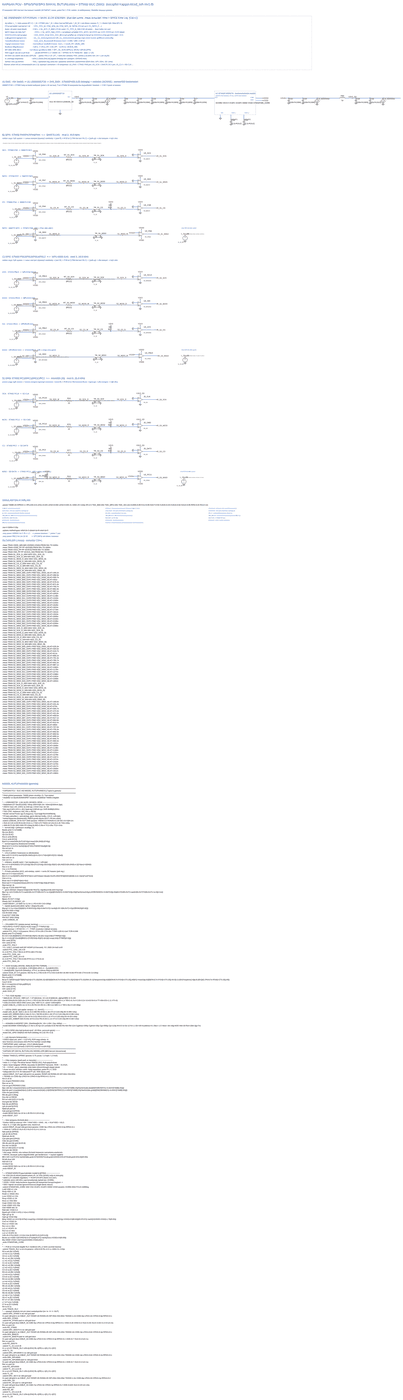
[diagram p0: schematic Kapgan_SPI_SI.asc, whole sheet]
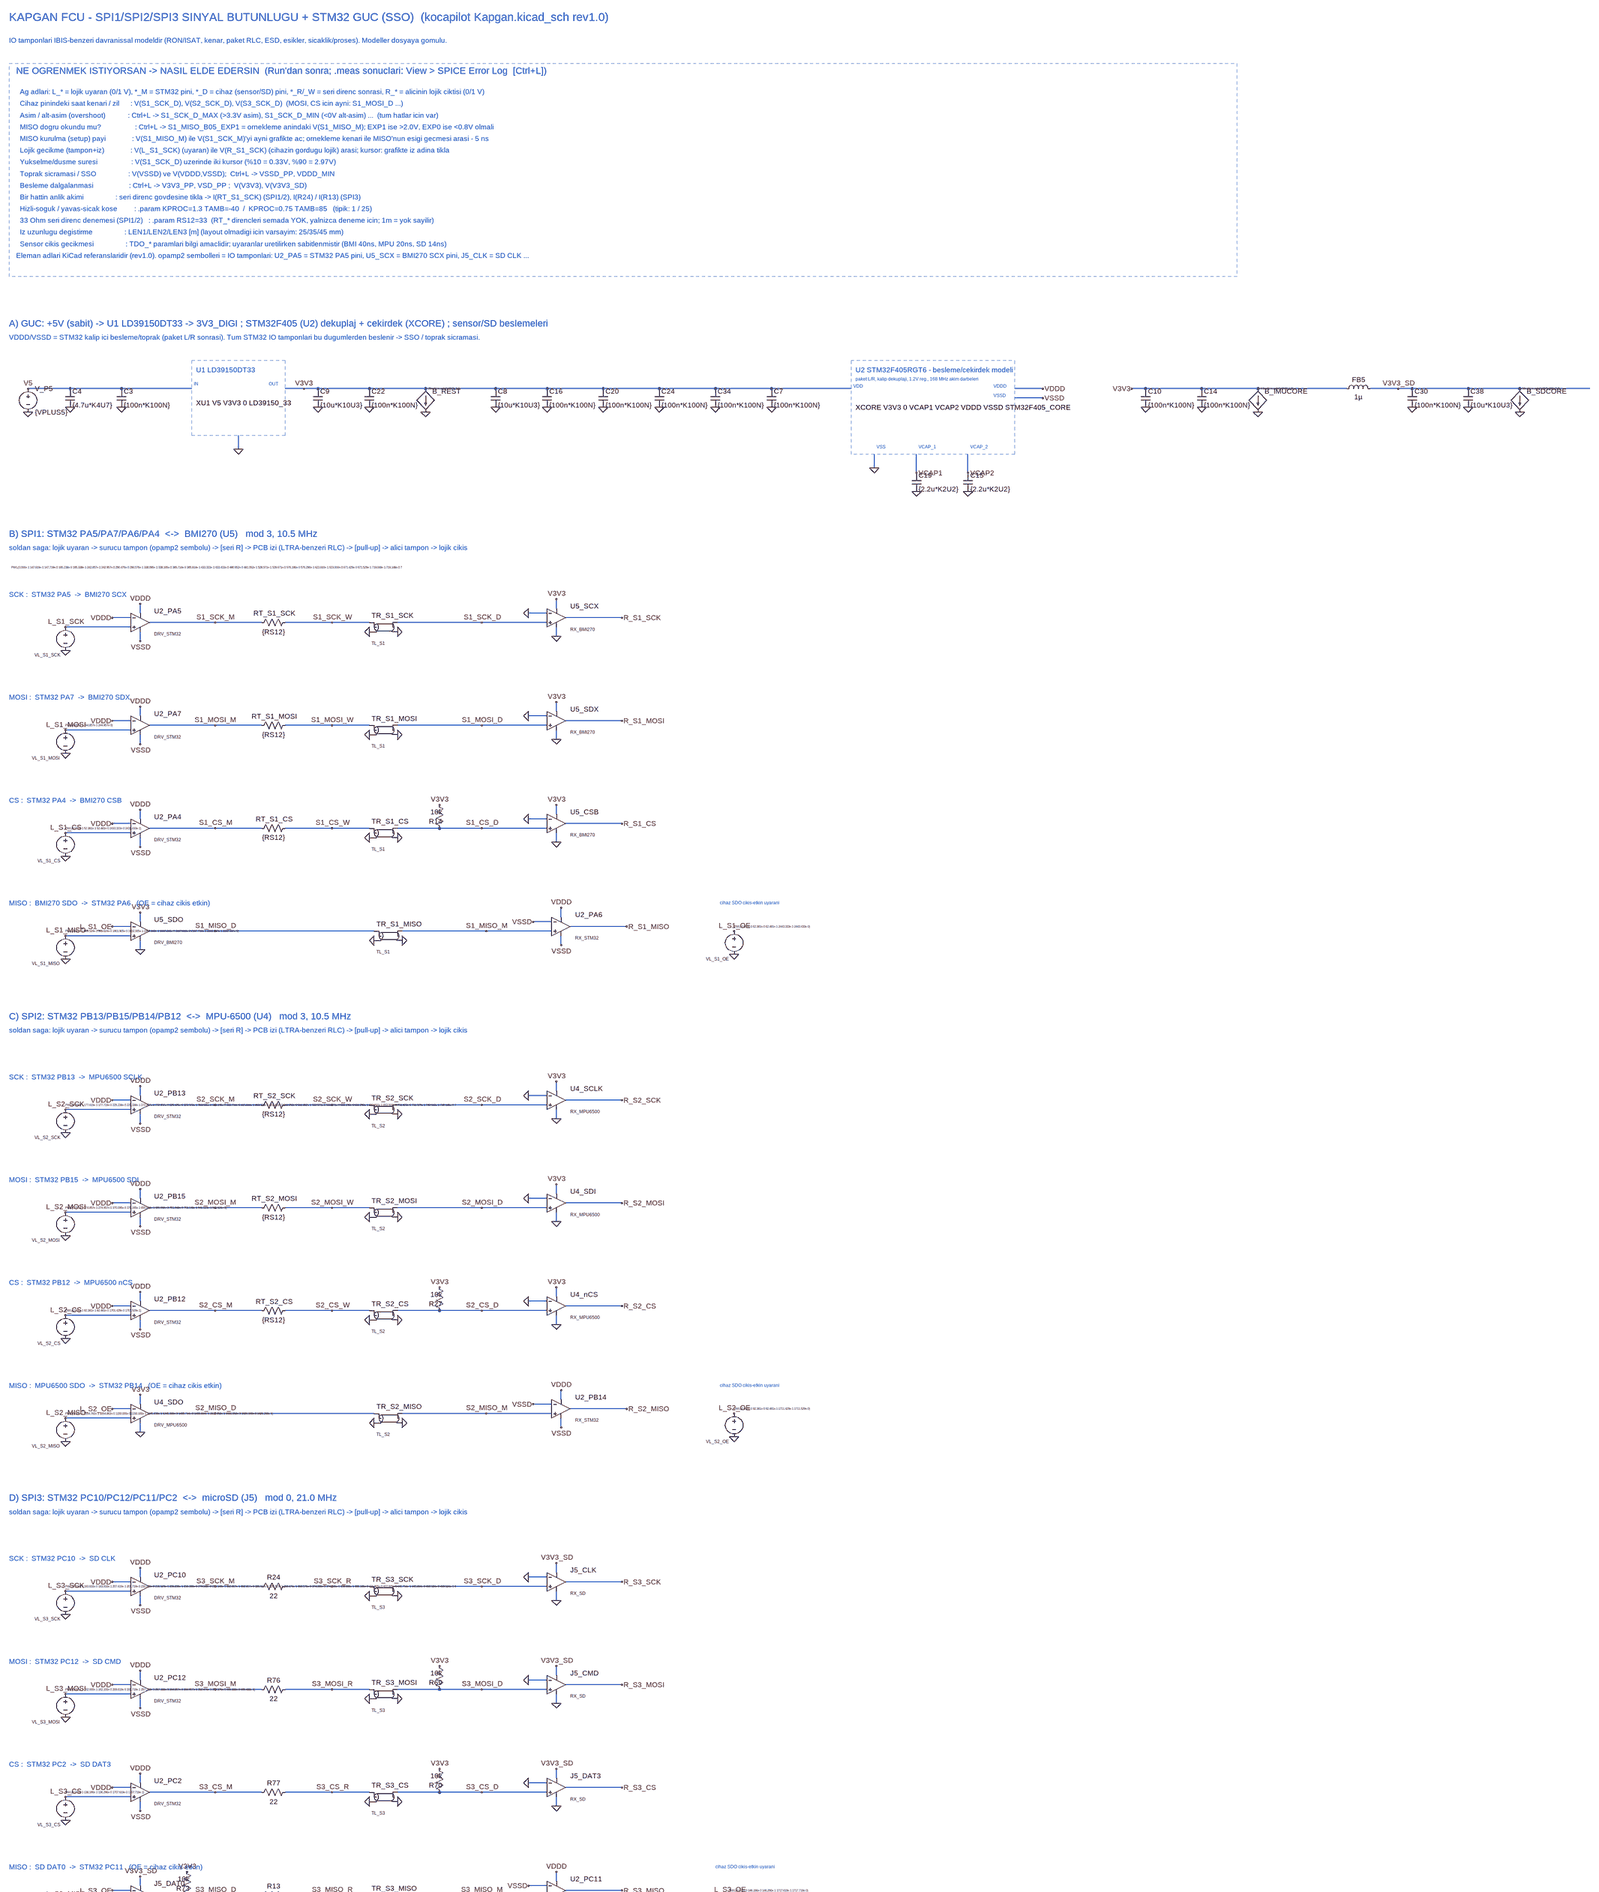
[diagram p1: schematic Kapgan_SPI_SI.asc, part, row 1 of 3, column 1 of 1]
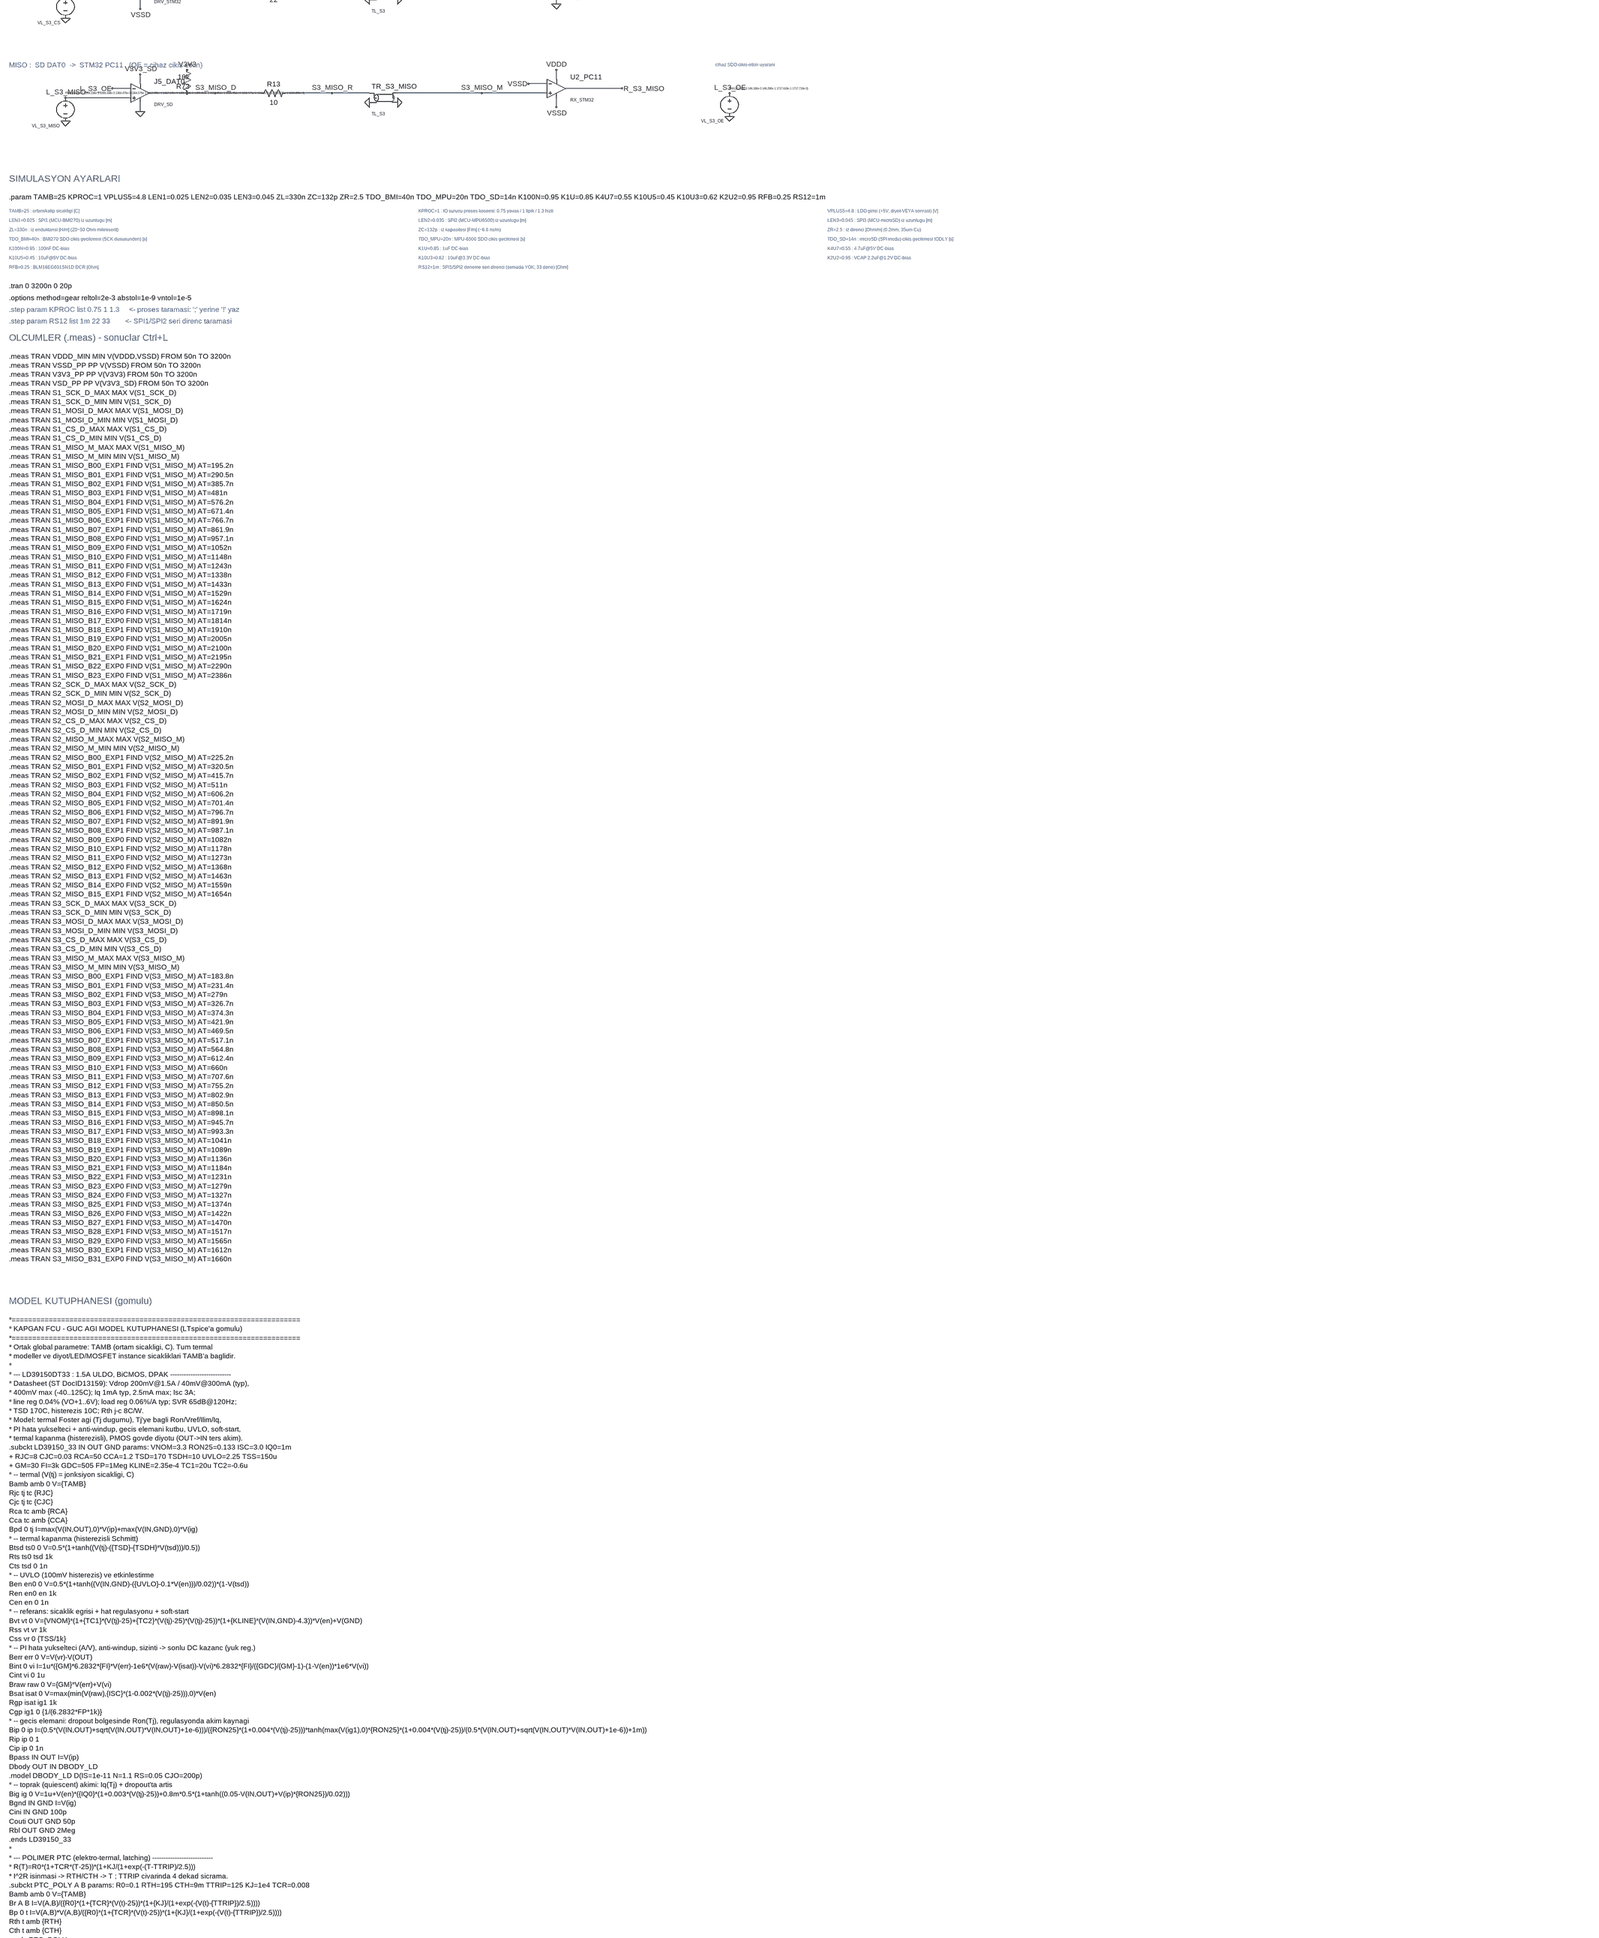
[diagram p2: schematic Kapgan_SPI_SI.asc, part, row 2 of 3, column 1 of 1]
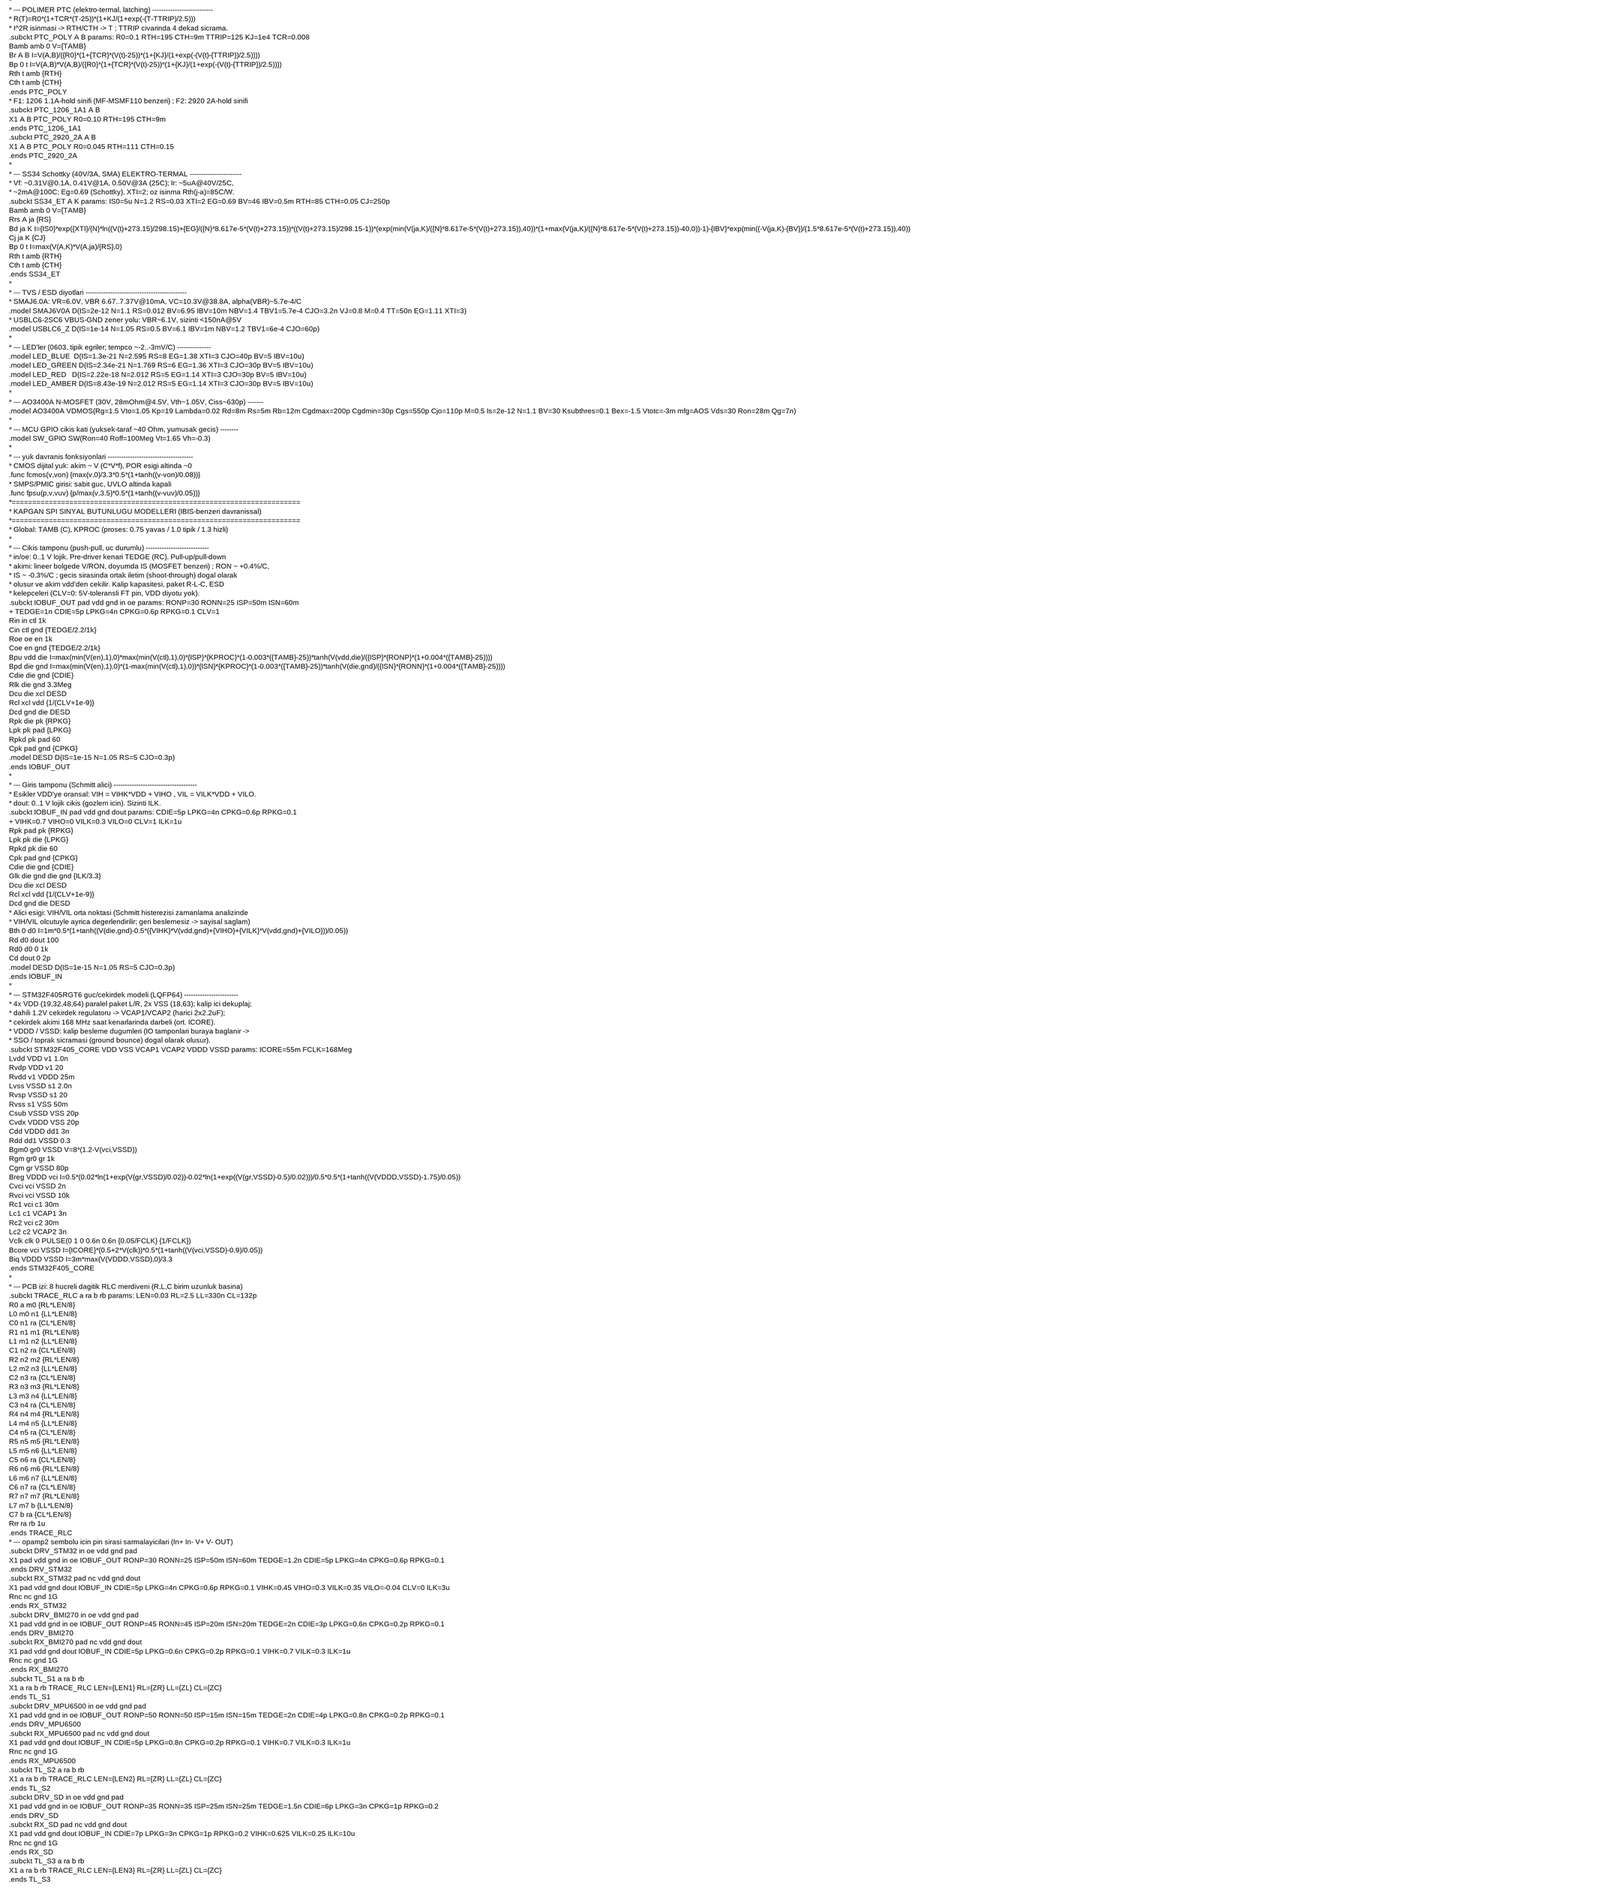
[diagram p3: schematic Kapgan_SPI_SI.asc, part, row 3 of 3, column 1 of 1]
* Kapgan_SPI_SI.asc
V_P5 V5 0 {VPLUS5}
C4 V5 0 {4.7u*K4U7} Rser=6m Lser=0.75n
C3 V5 0 {100n*K100N} Rser=30m Lser=0.6n
C9 V3V3 0 {10u*K10U3} Rser=4m Lser=0.8n
C22 V3V3 0 {100n*K100N} Rser=30m Lser=0.6n
B_REST V3V3 0 I=25m*fcmos(V(V3V3),1.6)
C8 V3V3 0 {10u*K10U3} Rser=4m Lser=0.8n
C16 V3V3 0 {100n*K100N} Rser=30m Lser=0.6n
C20 V3V3 0 {100n*K100N} Rser=30m Lser=0.6n
C24 V3V3 0 {100n*K100N} Rser=30m Lser=0.6n
C34 V3V3 0 {100n*K100N} Rser=30m Lser=0.6n
C7 V3V3 0 {100n*K100N} Rser=30m Lser=0.6n
C19 VCAP1 0 {2.2u*K2U2} Rser=10m Lser=0.6n
C15 VCAP2 0 {2.2u*K2U2} Rser=10m Lser=0.6n
C10 V3V3 0 {100n*K100N} Rser=30m Lser=0.6n
C14 V3V3 0 {100n*K100N} Rser=30m Lser=0.6n
B_IMUCORE V3V3 0 I=4.5m*fcmos(V(V3V3),1.6)
L§FB5 V3V3 V3V3_SD 1µ Rser={RFB} Rpar=650 Cpar=1.2p
C30 V3V3_SD 0 {100n*K100N} Rser=30m Lser=0.6n
C38 V3V3_SD 0 {10u*K10U3} Rser=4m Lser=0.8n
B_SDCORE V3V3_SD 0 I=50m*fcmos(V(V3V3_SD),2.7)
VL_S1_SCK L_S1_SCK 0 PWL(0.000n 1 147.619n 1 147.719n 0 195.238n 0 195.338n 1 242.857n 1 242.957n 0 290.476n 0 290.576n 1 338.095n 1 338.195n 0 385.714n 0 385.814n 1 433.333n 1 433.433n 0 480.952n 0 481.052n 1 528.571n 1 528.671n 0 576.190n 0 576.290n 1 623.810n 1 623.910n 0 671.429n 0 671.529n 1 719.048n 1 719.148n 0 766.667n 0 766.767n 1 814.286n 1 814.386n 0 861.905n 0 862.005n 1 909.524n 1 909.624n 0 957.143n 0 957.243n 1 1004.762n 1 1004.862n 0 1052.381n 0 1052.481n 1 1100.000n 1 1100.100n 0 1147.619n 0 1147.719n 1 1195.238n 1 1195.338n 0 1242.857n 0 1242.957n 1 1290.476n 1 1290.576n 0 1338.095n 0 1338.195n 1 1385.714n 1 1385.814n 0 1433.333n 0 1433.433n 1 1480.952n 1 1481.052n 0 1528.571n 0 1528.671n 1 1576.190n 1 1576.290n 0 1623.810n 0 1623.910n 1 1671.429n 1 1671.529n 0 1719.048n 0 1719.148n 1 1766.667n 1 1766.767n 0 1814.286n 0 1814.386n 1 1861.905n 1 1862.005n 0 1909.524n 0 1909.624n 1 1957.143n 1 1957.243n 0 2004.762n 0 2004.862n 1 2052.381n 1 2052.481n 0 2100.000n 0 2100.100n 1 2147.619n 1 2147.719n 0 2195.238n 0 2195.338n 1 2242.857n 1 2242.957n 0 2290.476n 0 2290.576n 1 2338.095n 1 2338.195n 0 2385.714n 0 2385.814n 1)
X§U2_PA5 L_S1_SCK VDDD VDDD VSSD S1_SCK_M DRV_STM32  ; pins In+ In- V+ V- OUT
RT_S1_SCK S1_SCK_M S1_SCK_W {RS12}
X§TR_S1_SCK S1_SCK_W 0 S1_SCK_D 0 TL_S1  ; pins I1 R1 I2 R2
X§U5_SCX S1_SCK_D 0 V3V3 0 R_S1_SCK RX_BMI270  ; pins In+ In- V+ V- OUT
VL_S1_MOSI L_S1_MOSI 0 PWL(0.000n 1 244.857n 1 244.957n 0)
X§U2_PA7 L_S1_MOSI VDDD VDDD VSSD S1_MOSI_M DRV_STM32  ; pins In+ In- V+ V- OUT
RT_S1_MOSI S1_MOSI_M S1_MOSI_W {RS12}
X§TR_S1_MOSI S1_MOSI_W 0 S1_MOSI_D 0 TL_S1  ; pins I1 R1 I2 R2
X§U5_SDX S1_MOSI_D 0 V3V3 0 R_S1_MOSI RX_BMI270  ; pins In+ In- V+ V- OUT
VL_S1_CS L_S1_CS 0 PWL(0.000n 1 52.381n 1 52.481n 0 2433.333n 0 2433.433n 1)
X§U2_PA4 L_S1_CS VDDD VDDD VSSD S1_CS_M DRV_STM32  ; pins In+ In- V+ V- OUT
RT_S1_CS S1_CS_M S1_CS_W {RS12}
X§TR_S1_CS S1_CS_W 0 S1_CS_D 0 TL_S1  ; pins I1 R1 I2 R2
R14 S1_CS_D V3V3 10k
X§U5_CSB S1_CS_D 0 V3V3 0 R_S1_CS RX_BMI270  ; pins In+ In- V+ V- OUT
VL_S1_MISO L_S1_MISO 0 PWL(0.000n 1 949.524n 1 949.624n 0 1901.905n 0 1902.005n 1 1997.143n 1 1997.243n 0 2187.619n 0 2187.719n 1 2282.857n 1 2282.957n 0)
X§U5_SDO L_S1_MISO L_S1_OE V3V3 0 S1_MISO_D DRV_BMI270  ; pins In+ In- V+ V- OUT
X§TR_S1_MISO S1_MISO_D 0 S1_MISO_M 0 TL_S1  ; pins I1 R1 I2 R2
X§U2_PA6 S1_MISO_M VSSD VDDD VSSD R_S1_MISO RX_STM32  ; pins In+ In- V+ V- OUT
VL_S1_OE L_S1_OE 0 PWL(0.000n 0 62.381n 0 62.481n 1 2443.333n 1 2443.433n 0)
VL_S2_SCK L_S2_SCK 0 PWL(0.000n 1 177.619n 1 177.719n 0 225.238n 0 225.338n 1 272.857n 1 272.957n 0 320.476n 0 320.576n 1 368.095n 1 368.195n 0 415.714n 0 415.814n 1 463.333n 1 463.433n 0 510.952n 0 511.052n 1 558.571n 1 558.671n 0 606.190n 0 606.290n 1 653.810n 1 653.910n 0 701.429n 0 701.529n 1 749.048n 1 749.148n 0 796.667n 0 796.767n 1 844.286n 1 844.386n 0 891.905n 0 892.005n 1 939.524n 1 939.624n 0 987.143n 0 987.243n 1 1034.762n 1 1034.862n 0 1082.381n 0 1082.481n 1 1130.000n 1 1130.100n 0 1177.619n 0 1177.719n 1 1225.238n 1 1225.338n 0 1272.857n 0 1272.957n 1 1320.476n 1 1320.576n 0 1368.095n 0 1368.195n 1 1415.714n 1 1415.814n 0 1463.333n 0 1463.433n 1 1510.952n 1 1511.052n 0 1558.571n 0 1558.671n 1 1606.190n 1 1606.290n 0 1653.810n 0 1653.910n 1)
X§U2_PB13 L_S2_SCK VDDD VDDD VSSD S2_SCK_M DRV_STM32  ; pins In+ In- V+ V- OUT
RT_S2_SCK S2_SCK_M S2_SCK_W {RS12}
X§TR_S2_SCK S2_SCK_W 0 S2_SCK_D 0 TL_S2  ; pins I1 R1 I2 R2
X§U4_SCLK S2_SCK_D 0 V3V3 0 R_S2_SCK RX_MPU6500  ; pins In+ In- V+ V- OUT
VL_S2_MOSI L_S2_MOSI 0 PWL(0.000n 1 274.857n 1 274.957n 0 370.095n 0 370.195n 1 655.810n 1 655.910n 0 751.048n 0 751.148n 1 941.524n 1 941.624n 0)
X§U2_PB15 L_S2_MOSI VDDD VDDD VSSD S2_MOSI_M DRV_STM32  ; pins In+ In- V+ V- OUT
RT_S2_MOSI S2_MOSI_M S2_MOSI_W {RS12}
X§TR_S2_MOSI S2_MOSI_W 0 S2_MOSI_D 0 TL_S2  ; pins I1 R1 I2 R2
X§U4_SDI S2_MOSI_D 0 V3V3 0 R_S2_MOSI RX_MPU6500  ; pins In+ In- V+ V- OUT
VL_S2_CS L_S2_CS 0 PWL(0.000n 1 82.381n 1 82.481n 0 1701.429n 0 1701.529n 1)
X§U2_PB12 L_S2_CS VDDD VDDD VSSD S2_CS_M DRV_STM32  ; pins In+ In- V+ V- OUT
RT_S2_CS S2_CS_M S2_CS_W {RS12}
X§TR_S2_CS S2_CS_W 0 S2_CS_D 0 TL_S2  ; pins I1 R1 I2 R2
R27 S2_CS_D V3V3 10k
X§U4_nCS S2_CS_D 0 V3V3 0 R_S2_CS RX_MPU6500  ; pins In+ In- V+ V- OUT
VL_S2_MISO L_S2_MISO 0 PWL(0.000n 1 1054.762n 1 1054.862n 0 1150.000n 0 1150.100n 1 1245.238n 1 1245.338n 0 1435.714n 0 1435.814n 1 1530.952n 1 1531.052n 0 1626.190n 0 1626.290n 1)
X§U4_SDO L_S2_MISO L_S2_OE V3V3 0 S2_MISO_D DRV_MPU6500  ; pins In+ In- V+ V- OUT
X§TR_S2_MISO S2_MISO_D 0 S2_MISO_M 0 TL_S2  ; pins I1 R1 I2 R2
X§U2_PB14 S2_MISO_M VSSD VDDD VSSD R_S2_MISO RX_STM32  ; pins In+ In- V+ V- OUT
VL_S2_OE L_S2_OE 0 PWL(0.000n 0 92.381n 0 92.481n 1 1711.429n 1 1711.529n 0)
VL_S3_SCK L_S3_SCK 0 PWL(0.000n 0 183.810n 0 183.910n 1 207.619n 1 207.719n 0 231.429n 0 231.529n 1 255.238n 1 255.338n 0 279.048n 0 279.148n 1 302.857n 1 302.957n 0 326.667n 0 326.767n 1 350.476n 1 350.576n 0 374.286n 0 374.386n 1 398.095n 1 398.195n 0 421.905n 0 422.005n 1 445.714n 1 445.814n 0 469.524n 0 469.624n 1 493.333n 1 493.433n 0 517.143n 0 517.243n 1 540.952n 1 541.052n 0 564.762n 0 564.862n 1 588.571n 1 588.671n 0 612.381n 0 612.481n 1 636.190n 1 636.290n 0 660.000n 0 660.100n 1 683.810n 1 683.910n 0 707.619n 0 707.719n 1 731.429n 1 731.529n 0 755.238n 0 755.338n 1 779.048n 1 779.148n 0 802.857n 0 802.957n 1 826.667n 1 826.767n 0 850.476n 0 850.576n 1 874.286n 1 874.386n 0 898.095n 0 898.195n 1 921.905n 1 922.005n 0 945.714n 0 945.814n 1 969.524n 1 969.624n 0 993.333n 0 993.433n 1 1017.143n 1 1017.243n 0 1040.952n 0 1041.052n 1 1064.762n 1 1064.862n 0 1088.571n 0 1088.671n 1 1112.381n 1 1112.481n 0 1136.190n 0 1136.290n 1 1160.000n 1 1160.100n 0 1183.810n 0 1183.910n 1 1207.619n 1 1207.719n 0 1231.429n 0 1231.529n 1 1255.238n 1 1255.338n 0 1279.048n 0 1279.148n 1 1302.857n 1 1302.957n 0 1326.667n 0 1326.767n 1 1350.476n 1 1350.576n 0 1374.286n 0 1374.386n 1 1398.095n 1 1398.195n 0 1421.905n 0 1422.005n 1 1445.714n 1 1445.814n 0 1469.524n 0 1469.624n 1 1493.333n 1 1493.433n 0 1517.143n 0 1517.243n 1 1540.952n 1 1541.052n 0 1564.762n 0 1564.862n 1 1588.571n 1 1588.671n 0 1612.381n 0 1612.481n 1 1636.190n 1 1636.290n 0 1660.000n 0 1660.100n 1 1683.810n 1 1683.910n 0)
X§U2_PC10 L_S3_SCK VDDD VDDD VSSD S3_SCK_M DRV_STM32  ; pins In+ In- V+ V- OUT
R24 S3_SCK_M S3_SCK_R 22
X§TR_S3_SCK S3_SCK_R 0 S3_SCK_D 0 TL_S3  ; pins I1 R1 I2 R2
X§J5_CLK S3_SCK_D 0 V3V3_SD 0 R_S3_SCK RX_SD  ; pins In+ In- V+ V- OUT
VL_S3_MOSI L_S3_MOSI 0 PWL(0.000n 1 162.000n 1 162.100n 0 209.619n 0 209.719n 1 257.238n 1 257.338n 0 304.857n 0 304.957n 1 352.476n 1 352.576n 0 495.333n 0 495.433n 1)
X§U2_PC12 L_S3_MOSI VDDD VDDD VSSD S3_MOSI_M DRV_STM32  ; pins In+ In- V+ V- OUT
R76 S3_MOSI_M S3_MOSI_R 22
X§TR_S3_MOSI S3_MOSI_R 0 S3_MOSI_D 0 TL_S3  ; pins I1 R1 I2 R2
R69 S3_MOSI_D V3V3 10k
X§J5_CMD S3_MOSI_D 0 V3V3_SD 0 R_S3_MOSI RX_SD  ; pins In+ In- V+ V- OUT
VL_S3_CS L_S3_CS 0 PWL(0.000n 1 136.190n 1 136.290n 0 1707.619n 0 1707.719n 1)
X§U2_PC2 L_S3_CS VDDD VDDD VSSD S3_CS_M DRV_STM32  ; pins In+ In- V+ V- OUT
R77 S3_CS_M S3_CS_R 22
X§TR_S3_CS S3_CS_R 0 S3_CS_D 0 TL_S3  ; pins I1 R1 I2 R2
R70 S3_CS_D V3V3 10k
X§J5_DAT3 S3_CS_D 0 V3V3_SD 0 R_S3_CS RX_SD  ; pins In+ In- V+ V- OUT
VL_S3_MISO L_S3_MISO 0 PWL(0.000n 1 1269.238n 1 1269.338n 0 1364.476n 0 1364.576n 1 1412.095n 1 1412.195n 0 1459.714n 0 1459.814n 1 1554.952n 1 1555.052n 0 1602.571n 0 1602.671n 1 1650.190n 1 1650.290n 0)
X§J5_DAT0 L_S3_MISO L_S3_OE V3V3_SD 0 S3_MISO_D DRV_SD  ; pins In+ In- V+ V- OUT
R73 S3_MISO_D V3V3 10k
R13 S3_MISO_D S3_MISO_R 10
X§TR_S3_MISO S3_MISO_R 0 S3_MISO_M 0 TL_S3  ; pins I1 R1 I2 R2
X§U2_PC11 S3_MISO_M VSSD VDDD VSSD R_S3_MISO RX_STM32  ; pins In+ In- V+ V- OUT
VL_S3_OE L_S3_OE 0 PWL(0.000n 0 146.190n 0 146.290n 1 1717.619n 1 1717.719n 0)
* KAPGAN FCU - SPI1/SPI2/SPI3 SINYAL BUTUNLUGU + STM32 GUC (SSO)  (kocapilot Kapgan.kicad_sch rev1.0)
* IO tamponlari IBIS-benzeri davranissal modeldir (RON/ISAT, kenar, paket RLC, ESD, esikler, sicaklik/proses). Modeller dosyaya gomulu.
* NE OGRENMEK ISTIYORSAN -> NASIL ELDE EDERSIN  (Run'dan sonra; .meas sonuclari: View > SPICE Error Log  [Ctrl+L])
*   Ag adlari: L_* = lojik uyaran (0/1 V), *_M = STM32 pini, *_D = cihaz (sensor/SD) pini, *_R/_W = seri direnc sonrasi, R_* = alicinin lojik ciktisi (0/1 V)
*   Cihaz pinindeki saat kenari / zil      : V(S1_SCK_D), V(S2_SCK_D), V(S3_SCK_D)  (MOSI, CS icin ayni: S1_MOSI_D ...)
*   Asim / alt-asim (overshoot)            : Ctrl+L -> S1_SCK_D_MAX (>3.3V asim), S1_SCK_D_MIN (<0V alt-asim) ...  (tum hatlar icin var)
*   MISO dogru okundu mu?                  : Ctrl+L -> S1_MISO_B05_EXP1 = ornekleme anindaki V(S1_MISO_M); EXP1 ise >2.0V, EXP0 ise <0.8V olmali
*   MISO kurulma (setup) payi              : V(S1_MISO_M) ile V(S1_SCK_M)'yi ayni grafikte ac; ornekleme kenari ile MISO'nun esigi gecmesi arasi - 5 ns
*   Lojik gecikme (tampon+iz)              : V(L_S1_SCK) (uyaran) ile V(R_S1_SCK) (cihazin gordugu lojik) arasi; kursor: grafikte iz adina tikla
*   Yukselme/dusme suresi                  : V(S1_SCK_D) uzerinde iki kursor (%10 = 0.33V, %90 = 2.97V)
*   Toprak sicramasi / SSO                 : V(VSSD) ve V(VDDD,VSSD);  Ctrl+L -> VSSD_PP, VDDD_MIN
*   Besleme dalgalanmasi                   : Ctrl+L -> V3V3_PP, VSD_PP ;  V(V3V3), V(V3V3_SD)
*   Bir hattin anlik akimi                 : seri direnc govdesine tikla -> I(RT_S1_SCK) (SPI1/2), I(R24) / I(R13) (SPI3)
*   Hizli-soguk / yavas-sicak kose         : .param KPROC=1.3 TAMB=-40  /  KPROC=0.75 TAMB=85   (tipik: 1 / 25)
*   33 Ohm seri direnc denemesi (SPI1/2)   : .param RS12=33  (RT_* direncleri semada YOK, yalnizca deneme icin; 1m = yok sayilir)
*   Iz uzunlugu degistirme                 : LEN1/LEN2/LEN3 [m] (layout olmadigi icin varsayim: 25/35/45 mm)
*   Sensor cikis gecikmesi                 : TDO_* paramlari bilgi amaclidir; uyaranlar uretilirken sabitlenmistir (BMI 40ns, MPU 20ns, SD 14ns)
* Eleman adlari KiCad referanslaridir (rev1.0). opamp2 sembolleri = IO tamponlari: U2_PA5 = STM32 PA5 pini, U5_SCX = BMI270 SCX pini, J5_CLK = SD CLK ...
* A) GUC: +5V (sabit) -> U1 LD39150DT33 -> 3V3_DIGI ; STM32F405 (U2) dekuplaj + cekirdek (XCORE) ; sensor/SD beslemeleri
* VDDD/VSSD = STM32 kalip ici besleme/toprak (paket L/R sonrasi). Tum STM32 IO tamponlari bu dugumlerden beslenir -> SSO / toprak sicramasi.
* U1 LD39150DT33
* IN
* OUT
XU1 V5 V3V3 0 LD39150_33
* U2 STM32F405RGT6 - besleme/cekirdek modeli
* paket L/R, kalip dekuplaji, 1.2V reg., 168 MHz akim darbeleri
XCORE V3V3 0 VCAP1 VCAP2 VDDD VSSD STM32F405_CORE
* VDD
* VSS
* VCAP_1
* VCAP_2
* VDDD
* VSSD
* B) SPI1: STM32 PA5/PA7/PA6/PA4  <->  BMI270 (U5)   mod 3, 10.5 MHz
* soldan saga: lojik uyaran -> surucu tampon (opamp2 sembolu) -> [seri R] -> PCB izi (LTRA-benzeri RLC) -> [pull-up] -> alici tampon -> lojik cikis
* SCK :  STM32 PA5  ->  BMI270 SCX
* MOSI :  STM32 PA7  ->  BMI270 SDX
* CS :  STM32 PA4  ->  BMI270 CSB
* MISO :  BMI270 SDO  ->  STM32 PA6   (OE = cihaz cikis etkin)
* cihaz SDO cikis-etkin uyarani
* C) SPI2: STM32 PB13/PB15/PB14/PB12  <->  MPU-6500 (U4)   mod 3, 10.5 MHz
* soldan saga: lojik uyaran -> surucu tampon (opamp2 sembolu) -> [seri R] -> PCB izi (LTRA-benzeri RLC) -> [pull-up] -> alici tampon -> lojik cikis
* SCK :  STM32 PB13  ->  MPU6500 SCLK
* MOSI :  STM32 PB15  ->  MPU6500 SDI
* CS :  STM32 PB12  ->  MPU6500 nCS
* MISO :  MPU6500 SDO  ->  STM32 PB14   (OE = cihaz cikis etkin)
* cihaz SDO cikis-etkin uyarani
* D) SPI3: STM32 PC10/PC12/PC11/PC2  <->  microSD (J5)   mod 0, 21.0 MHz
* soldan saga: lojik uyaran -> surucu tampon (opamp2 sembolu) -> [seri R] -> PCB izi (LTRA-benzeri RLC) -> [pull-up] -> alici tampon -> lojik cikis
* SCK :  STM32 PC10  ->  SD CLK
* MOSI :  STM32 PC12  ->  SD CMD
* CS :  STM32 PC2  ->  SD DAT3
* MISO :  SD DAT0  ->  STM32 PC11   (OE = cihaz cikis etkin)
* cihaz SDO cikis-etkin uyarani
* SIMULASYON AYARLARI
.param TAMB=25 KPROC=1 VPLUS5=4.8 LEN1=0.025 LEN2=0.035 LEN3=0.045 ZL=330n ZC=132p ZR=2.5 TDO_BMI=40n TDO_MPU=20n TDO_SD=14n K100N=0.95 K1U=0.85 K4U7=0.55 K10U5=0.45 K10U3=0.62 K2U2=0.95 RFB=0.25 RS12=1m
* TAMB=25 : ortam/kalip sicakligi [C]
* KPROC=1 : IO surucu proses koseesi: 0.75 yavas / 1 tipik / 1.3 hizli
* VPLUS5=4.8 : LDO girisi (+5V, diyot-VEYA sonrasi) [V]
* LEN1=0.025 : SPI1 (MCU-BMI270) iz uzunlugu [m]
* LEN2=0.035 : SPI2 (MCU-MPU6500) iz uzunlugu [m]
* LEN3=0.045 : SPI3 (MCU-microSD) iz uzunlugu [m]
* ZL=330n : iz enduktansi [H/m] (Z0~50 Ohm mikroserit)
* ZC=132p : iz kapasitesi [F/m] (~6.6 ns/m)
* ZR=2.5 : iz direnci [Ohm/m] (0.2mm, 35um Cu)
* TDO_BMI=40n : BMI270 SDO cikis gecikmesi (SCK dususunden) [s]
* TDO_MPU=20n : MPU-6500 SDO cikis gecikmesi [s]
* TDO_SD=14n : microSD (SPI modu) cikis gecikmesi tODLY [s]
* K100N=0.95 : 100nF DC-bias
* K1U=0.85 : 1uF DC-bias
* K4U7=0.55 : 4.7uF@5V DC-bias
* K10U5=0.45 : 10uF@5V DC-bias
* K10U3=0.62 : 10uF@3.3V DC-bias
* K2U2=0.95 : VCAP 2.2uF@1.2V DC-bias
* RFB=0.25 : BLM18EG601SN1D DCR [Ohm]
* RS12=1m : SPI1/SPI2 deneme seri direnci (semada YOK; 33 dene) [Ohm]
.tran 0 3200n 0 20p
.options method=gear reltol=2e-3 abstol=1e-9 vntol=1e-5
* .step param KPROC list 0.75 1 1.3     <- proses taramasi: ';' yerine '!' yaz
* .step param RS12 list 1m 22 33        <- SPI1/SPI2 seri direnc taramasi
* OLCUMLER (.meas) - sonuclar Ctrl+L
.meas TRAN VDDD_MIN MIN V(VDDD,VSSD) FROM 50n TO 3200n
.meas TRAN VSSD_PP PP V(VSSD) FROM 50n TO 3200n
.meas TRAN V3V3_PP PP V(V3V3) FROM 50n TO 3200n
.meas TRAN VSD_PP PP V(V3V3_SD) FROM 50n TO 3200n
.meas TRAN S1_SCK_D_MAX MAX V(S1_SCK_D)
.meas TRAN S1_SCK_D_MIN MIN V(S1_SCK_D)
.meas TRAN S1_MOSI_D_MAX MAX V(S1_MOSI_D)
.meas TRAN S1_MOSI_D_MIN MIN V(S1_MOSI_D)
.meas TRAN S1_CS_D_MAX MAX V(S1_CS_D)
.meas TRAN S1_CS_D_MIN MIN V(S1_CS_D)
.meas TRAN S1_MISO_M_MAX MAX V(S1_MISO_M)
.meas TRAN S1_MISO_M_MIN MIN V(S1_MISO_M)
.meas TRAN S1_MISO_B00_EXP1 FIND V(S1_MISO_M) AT=195.2n
.meas TRAN S1_MISO_B01_EXP1 FIND V(S1_MISO_M) AT=290.5n
.meas TRAN S1_MISO_B02_EXP1 FIND V(S1_MISO_M) AT=385.7n
.meas TRAN S1_MISO_B03_EXP1 FIND V(S1_MISO_M) AT=481n
.meas TRAN S1_MISO_B04_EXP1 FIND V(S1_MISO_M) AT=576.2n
.meas TRAN S1_MISO_B05_EXP1 FIND V(S1_MISO_M) AT=671.4n
.meas TRAN S1_MISO_B06_EXP1 FIND V(S1_MISO_M) AT=766.7n
.meas TRAN S1_MISO_B07_EXP1 FIND V(S1_MISO_M) AT=861.9n
.meas TRAN S1_MISO_B08_EXP0 FIND V(S1_MISO_M) AT=957.1n
.meas TRAN S1_MISO_B09_EXP0 FIND V(S1_MISO_M) AT=1052n
.meas TRAN S1_MISO_B10_EXP0 FIND V(S1_MISO_M) AT=1148n
.meas TRAN S1_MISO_B11_EXP0 FIND V(S1_MISO_M) AT=1243n
.meas TRAN S1_MISO_B12_EXP0 FIND V(S1_MISO_M) AT=1338n
.meas TRAN S1_MISO_B13_EXP0 FIND V(S1_MISO_M) AT=1433n
.meas TRAN S1_MISO_B14_EXP0 FIND V(S1_MISO_M) AT=1529n
.meas TRAN S1_MISO_B15_EXP0 FIND V(S1_MISO_M) AT=1624n
.meas TRAN S1_MISO_B16_EXP0 FIND V(S1_MISO_M) AT=1719n
.meas TRAN S1_MISO_B17_EXP0 FIND V(S1_MISO_M) AT=1814n
.meas TRAN S1_MISO_B18_EXP1 FIND V(S1_MISO_M) AT=1910n
.meas TRAN S1_MISO_B19_EXP0 FIND V(S1_MISO_M) AT=2005n
.meas TRAN S1_MISO_B20_EXP0 FIND V(S1_MISO_M) AT=2100n
.meas TRAN S1_MISO_B21_EXP1 FIND V(S1_MISO_M) AT=2195n
.meas TRAN S1_MISO_B22_EXP0 FIND V(S1_MISO_M) AT=2290n
.meas TRAN S1_MISO_B23_EXP0 FIND V(S1_MISO_M) AT=2386n
.meas TRAN S2_SCK_D_MAX MAX V(S2_SCK_D)
.meas TRAN S2_SCK_D_MIN MIN V(S2_SCK_D)
.meas TRAN S2_MOSI_D_MAX MAX V(S2_MOSI_D)
.meas TRAN S2_MOSI_D_MIN MIN V(S2_MOSI_D)
.meas TRAN S2_CS_D_MAX MAX V(S2_CS_D)
.meas TRAN S2_CS_D_MIN MIN V(S2_CS_D)
.meas TRAN S2_MISO_M_MAX MAX V(S2_MISO_M)
.meas TRAN S2_MISO_M_MIN MIN V(S2_MISO_M)
.meas TRAN S2_MISO_B00_EXP1 FIND V(S2_MISO_M) AT=225.2n
.meas TRAN S2_MISO_B01_EXP1 FIND V(S2_MISO_M) AT=320.5n
.meas TRAN S2_MISO_B02_EXP1 FIND V(S2_MISO_M) AT=415.7n
.meas TRAN S2_MISO_B03_EXP1 FIND V(S2_MISO_M) AT=511n
.meas TRAN S2_MISO_B04_EXP1 FIND V(S2_MISO_M) AT=606.2n
.meas TRAN S2_MISO_B05_EXP1 FIND V(S2_MISO_M) AT=701.4n
.meas TRAN S2_MISO_B06_EXP1 FIND V(S2_MISO_M) AT=796.7n
.meas TRAN S2_MISO_B07_EXP1 FIND V(S2_MISO_M) AT=891.9n
.meas TRAN S2_MISO_B08_EXP1 FIND V(S2_MISO_M) AT=987.1n
.meas TRAN S2_MISO_B09_EXP0 FIND V(S2_MISO_M) AT=1082n
.meas TRAN S2_MISO_B10_EXP1 FIND V(S2_MISO_M) AT=1178n
.meas TRAN S2_MISO_B11_EXP0 FIND V(S2_MISO_M) AT=1273n
.meas TRAN S2_MISO_B12_EXP0 FIND V(S2_MISO_M) AT=1368n
.meas TRAN S2_MISO_B13_EXP1 FIND V(S2_MISO_M) AT=1463n
.meas TRAN S2_MISO_B14_EXP0 FIND V(S2_MISO_M) AT=1559n
.meas TRAN S2_MISO_B15_EXP1 FIND V(S2_MISO_M) AT=1654n
.meas TRAN S3_SCK_D_MAX MAX V(S3_SCK_D)
.meas TRAN S3_SCK_D_MIN MIN V(S3_SCK_D)
.meas TRAN S3_MOSI_D_MAX MAX V(S3_MOSI_D)
.meas TRAN S3_MOSI_D_MIN MIN V(S3_MOSI_D)
.meas TRAN S3_CS_D_MAX MAX V(S3_CS_D)
.meas TRAN S3_CS_D_MIN MIN V(S3_CS_D)
.meas TRAN S3_MISO_M_MAX MAX V(S3_MISO_M)
.meas TRAN S3_MISO_M_MIN MIN V(S3_MISO_M)
.meas TRAN S3_MISO_B00_EXP1 FIND V(S3_MISO_M) AT=183.8n
.meas TRAN S3_MISO_B01_EXP1 FIND V(S3_MISO_M) AT=231.4n
.meas TRAN S3_MISO_B02_EXP1 FIND V(S3_MISO_M) AT=279n
.meas TRAN S3_MISO_B03_EXP1 FIND V(S3_MISO_M) AT=326.7n
.meas TRAN S3_MISO_B04_EXP1 FIND V(S3_MISO_M) AT=374.3n
.meas TRAN S3_MISO_B05_EXP1 FIND V(S3_MISO_M) AT=421.9n
.meas TRAN S3_MISO_B06_EXP1 FIND V(S3_MISO_M) AT=469.5n
.meas TRAN S3_MISO_B07_EXP1 FIND V(S3_MISO_M) AT=517.1n
.meas TRAN S3_MISO_B08_EXP1 FIND V(S3_MISO_M) AT=564.8n
.meas TRAN S3_MISO_B09_EXP1 FIND V(S3_MISO_M) AT=612.4n
.meas TRAN S3_MISO_B10_EXP1 FIND V(S3_MISO_M) AT=660n
.meas TRAN S3_MISO_B11_EXP1 FIND V(S3_MISO_M) AT=707.6n
.meas TRAN S3_MISO_B12_EXP1 FIND V(S3_MISO_M) AT=755.2n
.meas TRAN S3_MISO_B13_EXP1 FIND V(S3_MISO_M) AT=802.9n
.meas TRAN S3_MISO_B14_EXP1 FIND V(S3_MISO_M) AT=850.5n
.meas TRAN S3_MISO_B15_EXP1 FIND V(S3_MISO_M) AT=898.1n
.meas TRAN S3_MISO_B16_EXP1 FIND V(S3_MISO_M) AT=945.7n
.meas TRAN S3_MISO_B17_EXP1 FIND V(S3_MISO_M) AT=993.3n
.meas TRAN S3_MISO_B18_EXP1 FIND V(S3_MISO_M) AT=1041n
.meas TRAN S3_MISO_B19_EXP1 FIND V(S3_MISO_M) AT=1089n
.meas TRAN S3_MISO_B20_EXP1 FIND V(S3_MISO_M) AT=1136n
.meas TRAN S3_MISO_B21_EXP1 FIND V(S3_MISO_M) AT=1184n
.meas TRAN S3_MISO_B22_EXP1 FIND V(S3_MISO_M) AT=1231n
.meas TRAN S3_MISO_B23_EXP0 FIND V(S3_MISO_M) AT=1279n
.meas TRAN S3_MISO_B24_EXP0 FIND V(S3_MISO_M) AT=1327n
.meas TRAN S3_MISO_B25_EXP1 FIND V(S3_MISO_M) AT=1374n
.meas TRAN S3_MISO_B26_EXP0 FIND V(S3_MISO_M) AT=1422n
.meas TRAN S3_MISO_B27_EXP1 FIND V(S3_MISO_M) AT=1470n
.meas TRAN S3_MISO_B28_EXP1 FIND V(S3_MISO_M) AT=1517n
.meas TRAN S3_MISO_B29_EXP0 FIND V(S3_MISO_M) AT=1565n
.meas TRAN S3_MISO_B30_EXP1 FIND V(S3_MISO_M) AT=1612n
.meas TRAN S3_MISO_B31_EXP0 FIND V(S3_MISO_M) AT=1660n
* MODEL KUTUPHANESI (gomulu)
*======================================================================
* KAPGAN FCU - GUC AGI MODEL KUTUPHANESI (LTspice'a gomulu)
*======================================================================
* Ortak global parametre: TAMB (ortam sicakligi, C). Tum termal
* modeller ve diyot/LED/MOSFET instance sicakliklari TAMB'a baglidir.
*
* --- LD39150DT33 : 1.5A ULDO, BiCMOS, DPAK ---------------------------
* Datasheet (ST DocID13159): Vdrop 200mV@1.5A / 40mV@300mA (typ),
* 400mV max (-40..125C); Iq 1mA typ, 2.5mA max; Isc 3A;
* line reg 0.04% (VO+1..6V); load reg 0.06%/A typ; SVR 65dB@120Hz;
* TSD 170C, histerezis 10C; Rth j-c 8C/W.
* Model: termal Foster agi (Tj dugumu), Tj'ye bagli Ron/Vref/Ilim/Iq,
* PI hata yukselteci + anti-windup, gecis elemani kutbu, UVLO, soft-start,
* termal kapanma (histerezisli), PMOS govde diyotu (OUT->IN ters akim).
.subckt LD39150_33 IN OUT GND params: VNOM=3.3 RON25=0.133 ISC=3.0 IQ0=1m
+ RJC=8 CJC=0.03 RCA=50 CCA=1.2 TSD=170 TSDH=10 UVLO=2.25 TSS=150u
+ GM=30 FI=3k GDC=505 FP=1Meg KLINE=2.35e-4 TC1=20u TC2=-0.6u
* -- termal (V(tj) = jonksiyon sicakligi, C)
Bamb amb 0 V={TAMB}
Rjc tj tc {RJC}
Cjc tj tc {CJC}
Rca tc amb {RCA}
Cca tc amb {CCA}
Bpd 0 tj I=max(V(IN,OUT),0)*V(ip)+max(V(IN,GND),0)*V(ig)
* -- termal kapanma (histerezisli Schmitt)
Btsd ts0 0 V=0.5*(1+tanh((V(tj)-({TSD}-{TSDH}*V(tsd)))/0.5))
Rts ts0 tsd 1k
Cts tsd 0 1n
* -- UVLO (100mV histerezis) ve etkinlestirme
Ben en0 0 V=0.5*(1+tanh((V(IN,GND)-({UVLO}-0.1*V(en)))/0.02))*(1-V(tsd))
Ren en0 en 1k
Cen en 0 1n
* -- referans: sicaklik egrisi + hat regulasyonu + soft-start
Bvt vt 0 V={VNOM}*(1+{TC1}*(V(tj)-25)+{TC2}*(V(tj)-25)*(V(tj)-25))*(1+{KLINE}*(V(IN,GND)-4.3))*V(en)+V(GND)
Rss vt vr 1k
Css vr 0 {TSS/1k}
* -- PI hata yukselteci (A/V), anti-windup, sizinti -> sonlu DC kazanc (yuk reg.)
Berr err 0 V=V(vr)-V(OUT)
Bint 0 vi I=1u*({GM}*6.2832*{FI}*V(err)-1e6*(V(raw)-V(isat))-V(vi)*6.2832*{FI}/({GDC}/{GM}-1)-(1-V(en))*1e6*V(vi))
Cint vi 0 1u
Braw raw 0 V={GM}*V(err)+V(vi)
Bsat isat 0 V=max(min(V(raw),{ISC}*(1-0.002*(V(tj)-25))),0)*V(en)
Rgp isat ig1 1k
Cgp ig1 0 {1/(6.2832*FP*1k)}
* -- gecis elemani: dropout bolgesinde Ron(Tj), regulasyonda akim kaynagi
Bip 0 ip I=(0.5*(V(IN,OUT)+sqrt(V(IN,OUT)*V(IN,OUT)+1e-6)))/({RON25}*(1+0.004*(V(tj)-25)))*tanh(max(V(ig1),0)*{RON25}*(1+0.004*(V(tj)-25))/(0.5*(V(IN,OUT)+sqrt(V(IN,OUT)*V(IN,OUT)+1e-6))+1m))
Rip ip 0 1
Cip ip 0 1n
Bpass IN OUT I=V(ip)
Dbody OUT IN DBODY_LD
.model DBODY_LD D(IS=1e-11 N=1.1 RS=0.05 CJO=200p)
* -- toprak (quiescent) akimi: Iq(Tj) + dropout'ta artis
Big ig 0 V=1u+V(en)*({IQ0}*(1+0.003*(V(tj)-25))+0.8m*0.5*(1+tanh((0.05-V(IN,OUT)+V(ip)*{RON25})/0.02)))
Bgnd IN GND I=V(ig)
Cini IN GND 100p
Couti OUT GND 50p
Rbl OUT GND 2Meg
.ends LD39150_33
*
* --- POLIMER PTC (elektro-termal, latching) ---------------------------
* R(T)=R0*(1+TCR*(T-25))*(1+KJ/(1+exp(-(T-TTRIP)/2.5)))
* I^2R isinmasi -> RTH/CTH -> T ; TTRIP civarinda 4 dekad sicrama.
.subckt PTC_POLY A B params: R0=0.1 RTH=195 CTH=9m TTRIP=125 KJ=1e4 TCR=0.008
Bamb amb 0 V={TAMB}
Br A B I=V(A,B)/({R0}*(1+{TCR}*(V(t)-25))*(1+{KJ}/(1+exp(-(V(t)-{TTRIP})/2.5))))
Bp 0 t I=V(A,B)*V(A,B)/({R0}*(1+{TCR}*(V(t)-25))*(1+{KJ}/(1+exp(-(V(t)-{TTRIP})/2.5))))
Rth t amb {RTH}
Cth t amb {CTH}
.ends PTC_POLY
* F1: 1206 1.1A-hold sinifi (MF-MSMF110 benzeri) ; F2: 2920 2A-hold sinifi
.subckt PTC_1206_1A1 A B
X1 A B PTC_POLY R0=0.10 RTH=195 CTH=9m
.ends PTC_1206_1A1
.subckt PTC_2920_2A A B
X1 A B PTC_POLY R0=0.045 RTH=111 CTH=0.15
.ends PTC_2920_2A
*
* --- SS34 Schottky (40V/3A, SMA) ELEKTRO-TERMAL -----------------------
* Vf: ~0.31V@0.1A, 0.41V@1A, 0.50V@3A (25C); Ir: ~5uA@40V/25C,
* ~2mA@100C; Eg=0.69 (Schottky), XTI=2; oz isinma Rth(j-a)=85C/W.
.subckt SS34_ET A K params: IS0=5u N=1.2 RS=0.03 XTI=2 EG=0.69 BV=46 IBV=0.5m RTH=85 CTH=0.05 CJ=250p
Bamb amb 0 V={TAMB}
Rrs A ja {RS}
Bd ja K I={IS0}*exp({XTI}/{N}*ln((V(t)+273.15)/298.15)+{EG}/({N}*8.617e-5*(V(t)+273.15))*((V(t)+273.15)/298.15-1))*(exp(min(V(ja,K)/({N}*8.617e-5*(V(t)+273.15)),40))*(1+max(V(ja,K)/({N}*8.617e-5*(V(t)+273.15))-40,0))-1)-{IBV}*exp(min((-V(ja,K)-{BV})/(1.5*8.617e-5*(V(t)+273.15)),40))
Cj ja K {CJ}
Bp 0 t I=max(V(A,K)*V(A,ja)/{RS},0)
Rth t amb {RTH}
Cth t amb {CTH}
.ends SS34_ET
*
* --- TVS / ESD diyotlari ---------------------------------------------
* SMAJ6.0A: VR=6.0V, VBR 6.67..7.37V@10mA, VC=10.3V@38.8A, alpha(VBR)~5.7e-4/C
.model SMAJ6V0A D(IS=2e-12 N=1.1 RS=0.012 BV=6.95 IBV=10m NBV=1.4 TBV1=5.7e-4 CJO=3.2n VJ=0.8 M=0.4 TT=50n EG=1.11 XTI=3)
* USBLC6-2SC6 VBUS-GND zener yolu: VBR~6.1V, sizinti <150nA@5V
.model USBLC6_Z D(IS=1e-14 N=1.05 RS=0.5 BV=6.1 IBV=1m NBV=1.2 TBV1=6e-4 CJO=60p)
*
* --- LED'ler (0603, tipik egriler; tempco ~-2..-3mV/C) ---------------
.model LED_BLUE  D(IS=1.3e-21 N=2.595 RS=8 EG=1.38 XTI=3 CJO=40p BV=5 IBV=10u)
.model LED_GREEN D(IS=2.34e-21 N=1.769 RS=6 EG=1.36 XTI=3 CJO=30p BV=5 IBV=10u)
.model LED_RED   D(IS=2.22e-18 N=2.012 RS=5 EG=1.14 XTI=3 CJO=30p BV=5 IBV=10u)
.model LED_AMBER D(IS=8.43e-19 N=2.012 RS=5 EG=1.14 XTI=3 CJO=30p BV=5 IBV=10u)
*
* --- AO3400A N-MOSFET (30V, 28mOhm@4.5V, Vth~1.05V, Ciss~630p) -------
.model AO3400A VDMOS(Rg=1.5 Vto=1.05 Kp=19 Lambda=0.02 Rd=8m Rs=5m Rb=12m Cgdmax=200p Cgdmin=30p Cgs=550p Cjo=110p M=0.5 Is=2e-12 N=1.1 BV=30 Ksubthres=0.1 Bex=-1.5 Vtotc=-3m mfg=AOS Vds=30 Ron=28m Qg=7n)
*
* --- MCU GPIO cikis kati (yuksek-taraf ~40 Ohm, yumusak gecis) --------
.model SW_GPIO SW(Ron=40 Roff=100Meg Vt=1.65 Vh=-0.3)
*
* --- yuk davranis fonksiyonlari --------------------------------------
* CMOS dijital yuk: akim ~ V (C*V*f), POR esigi altinda ~0
.func fcmos(v,von) {max(v,0)/3.3*0.5*(1+tanh((v-von)/0.08))}
* SMPS/PMIC girisi: sabit guc, UVLO altinda kapali
.func fpsu(p,v,vuv) {p/max(v,3.5)*0.5*(1+tanh((v-vuv)/0.05))}
*======================================================================
* KAPGAN SPI SINYAL BUTUNLUGU MODELLERI (IBIS-benzeri davranissal)
*======================================================================
* Global: TAMB (C), KPROC (proses: 0.75 yavas / 1.0 tipik / 1.3 hizli)
*
* --- Cikis tamponu (push-pull, uc durumlu) ----------------------------
* in/oe: 0..1 V lojik. Pre-driver kenari TEDGE (RC). Pull-up/pull-down
* akimi: lineer bolgede V/RON, doyumda IS (MOSFET benzeri) ; RON ~ +0.4%/C,
* IS ~ -0.3%/C ; gecis sirasinda ortak iletim (shoot-through) dogal olarak
* olusur ve akim vdd'den cekilir. Kalip kapasitesi, paket R-L-C, ESD
* kelepceleri (CLV=0: 5V-toleransli FT pin, VDD diyotu yok).
.subckt IOBUF_OUT pad vdd gnd in oe params: RONP=30 RONN=25 ISP=50m ISN=60m
+ TEDGE=1n CDIE=5p LPKG=4n CPKG=0.6p RPKG=0.1 CLV=1
Rin in ctl 1k
Cin ctl gnd {TEDGE/2.2/1k}
Roe oe en 1k
Coe en gnd {TEDGE/2.2/1k}
Bpu vdd die I=max(min(V(en),1),0)*max(min(V(ctl),1),0)*{ISP}*{KPROC}*(1-0.003*({TAMB}-25))*tanh(V(vdd,die)/({ISP}*{RONP}*(1+0.004*({TAMB}-25))))
Bpd die gnd I=max(min(V(en),1),0)*(1-max(min(V(ctl),1),0))*{ISN}*{KPROC}*(1-0.003*({TAMB}-25))*tanh(V(die,gnd)/({ISN}*{RONN}*(1+0.004*({TAMB}-25))))
Cdie die gnd {CDIE}
Rlk die gnd 3.3Meg
Dcu die xcl DESD
Rcl xcl vdd {1/(CLV+1e-9)}
Dcd gnd die DESD
Rpk die pk {RPKG}
Lpk pk pad {LPKG}
Rpkd pk pad 60
Cpk pad gnd {CPKG}
.model DESD D(IS=1e-15 N=1.05 RS=5 CJO=0.3p)
.ends IOBUF_OUT
*
* --- Giris tamponu (Schmitt alici) -------------------------------------
* Esikler VDD'ye oransal: VIH = VIHK*VDD + VIHO , VIL = VILK*VDD + VILO.
* dout: 0..1 V lojik cikis (gozlem icin). Sizinti ILK.
.subckt IOBUF_IN pad vdd gnd dout params: CDIE=5p LPKG=4n CPKG=0.6p RPKG=0.1
+ VIHK=0.7 VIHO=0 VILK=0.3 VILO=0 CLV=1 ILK=1u
Rpk pad pk {RPKG}
Lpk pk die {LPKG}
Rpkd pk die 60
Cpk pad gnd {CPKG}
Cdie die gnd {CDIE}
Glk die gnd die gnd {ILK/3.3}
Dcu die xcl DESD
Rcl xcl vdd {1/(CLV+1e-9)}
Dcd gnd die DESD
* Alici esigi: VIH/VIL orta noktasi (Schmitt histerezisi zamanlama analizinde
* VIH/VIL olcutuyle ayrica degerlendirilir; geri beslemesiz -> sayisal saglam)
Bth 0 d0 I=1m*0.5*(1+tanh((V(die,gnd)-0.5*({VIHK}*V(vdd,gnd)+{VIHO}+{VILK}*V(vdd,gnd)+{VILO}))/0.05))
Rd d0 dout 100
Rd0 d0 0 1k
Cd dout 0 2p
.model DESD D(IS=1e-15 N=1.05 RS=5 CJO=0.3p)
.ends IOBUF_IN
*
* --- STM32F405RGT6 guc/cekirdek modeli (LQFP64) ------------------------
* 4x VDD (19,32,48,64) paralel paket L/R, 2x VSS (18,63); kalip ici dekuplaj;
* dahili 1.2V cekirdek regulatoru -> VCAP1/VCAP2 (harici 2x2.2uF);
* cekirdek akimi 168 MHz saat kenarlarinda darbeli (ort. ICORE).
* VDDD / VSSD: kalip besleme dugumleri (IO tamponlari buraya baglanir ->
* SSO / toprak sicramasi (ground bounce) dogal olarak olusur).
.subckt STM32F405_CORE VDD VSS VCAP1 VCAP2 VDDD VSSD params: ICORE=55m FCLK=168Meg
Lvdd VDD v1 1.0n
Rvdp VDD v1 20
Rvdd v1 VDDD 25m
Lvss VSSD s1 2.0n
Rvsp VSSD s1 20
Rvss s1 VSS 50m
Csub VSSD VSS 20p
Cvdx VDDD VSS 20p
Cdd VDDD dd1 3n
Rdd dd1 VSSD 0.3
Bgm0 gr0 VSSD V=8*(1.2-V(vci,VSSD))
Rgm gr0 gr 1k
Cgm gr VSSD 80p
Breg VDDD vci I=0.5*(0.02*ln(1+exp(V(gr,VSSD)/0.02))-0.02*ln(1+exp((V(gr,VSSD)-0.5)/0.02)))/0.5*0.5*(1+tanh((V(VDDD,VSSD)-1.75)/0.05))
Cvci vci VSSD 2n
Rvci vci VSSD 10k
Rc1 vci c1 30m
Lc1 c1 VCAP1 3n
Rc2 vci c2 30m
Lc2 c2 VCAP2 3n
Vclk clk 0 PULSE(0 1 0 0.6n 0.6n {0.05/FCLK} {1/FCLK})
Bcore vci VSSD I={ICORE}*(0.5+2*V(clk))*0.5*(1+tanh((V(vci,VSSD)-0.9)/0.05))
Biq VDDD VSSD I=3m*max(V(VDDD,VSSD),0)/3.3
.ends STM32F405_CORE
*
* --- PCB izi: 8 hucreli dagitik RLC merdiveni (R,L,C birim uzunluk basina)
.subckt TRACE_RLC a ra b rb params: LEN=0.03 RL=2.5 LL=330n CL=132p
R0 a m0 {RL*LEN/8}
L0 m0 n1 {LL*LEN/8}
C0 n1 ra {CL*LEN/8}
R1 n1 m1 {RL*LEN/8}
L1 m1 n2 {LL*LEN/8}
C1 n2 ra {CL*LEN/8}
R2 n2 m2 {RL*LEN/8}
L2 m2 n3 {LL*LEN/8}
C2 n3 ra {CL*LEN/8}
R3 n3 m3 {RL*LEN/8}
L3 m3 n4 {LL*LEN/8}
C3 n4 ra {CL*LEN/8}
R4 n4 m4 {RL*LEN/8}
L4 m4 n5 {LL*LEN/8}
C4 n5 ra {CL*LEN/8}
R5 n5 m5 {RL*LEN/8}
L5 m5 n6 {LL*LEN/8}
C5 n6 ra {CL*LEN/8}
R6 n6 m6 {RL*LEN/8}
L6 m6 n7 {LL*LEN/8}
C6 n7 ra {CL*LEN/8}
R7 n7 m7 {RL*LEN/8}
L7 m7 b {LL*LEN/8}
C7 b ra {CL*LEN/8}
Rrr ra rb 1u
.ends TRACE_RLC
* --- opamp2 sembolu icin pin sirasi sarmalayicilari (In+ In- V+ V- OUT)
.subckt DRV_STM32 in oe vdd gnd pad
X1 pad vdd gnd in oe IOBUF_OUT RONP=30 RONN=25 ISP=50m ISN=60m TEDGE=1.2n CDIE=5p LPKG=4n CPKG=0.6p RPKG=0.1
.ends DRV_STM32
.subckt RX_STM32 pad nc vdd gnd dout
X1 pad vdd gnd dout IOBUF_IN CDIE=5p LPKG=4n CPKG=0.6p RPKG=0.1 VIHK=0.45 VIHO=0.3 VILK=0.35 VILO=-0.04 CLV=0 ILK=3u
Rnc nc gnd 1G
.ends RX_STM32
.subckt DRV_BMI270 in oe vdd gnd pad
X1 pad vdd gnd in oe IOBUF_OUT RONP=45 RONN=45 ISP=20m ISN=20m TEDGE=2n CDIE=3p LPKG=0.6n CPKG=0.2p RPKG=0.1
.ends DRV_BMI270
.subckt RX_BMI270 pad nc vdd gnd dout
X1 pad vdd gnd dout IOBUF_IN CDIE=5p LPKG=0.6n CPKG=0.2p RPKG=0.1 VIHK=0.7 VILK=0.3 ILK=1u
Rnc nc gnd 1G
.ends RX_BMI270
.subckt TL_S1 a ra b rb
X1 a ra b rb TRACE_RLC LEN={LEN1} RL={ZR} LL={ZL} CL={ZC}
.ends TL_S1
.subckt DRV_MPU6500 in oe vdd gnd pad
X1 pad vdd gnd in oe IOBUF_OUT RONP=50 RONN=50 ISP=15m ISN=15m TEDGE=2n CDIE=4p LPKG=0.8n CPKG=0.2p RPKG=0.1
.ends DRV_MPU6500
.subckt RX_MPU6500 pad nc vdd gnd dout
X1 pad vdd gnd dout IOBUF_IN CDIE=5p LPKG=0.8n CPKG=0.2p RPKG=0.1 VIHK=0.7 VILK=0.3 ILK=1u
Rnc nc gnd 1G
.ends RX_MPU6500
.subckt TL_S2 a ra b rb
X1 a ra b rb TRACE_RLC LEN={LEN2} RL={ZR} LL={ZL} CL={ZC}
.ends TL_S2
.subckt DRV_SD in oe vdd gnd pad
X1 pad vdd gnd in oe IOBUF_OUT RONP=35 RONN=35 ISP=25m ISN=25m TEDGE=1.5n CDIE=6p LPKG=3n CPKG=1p RPKG=0.2
.ends DRV_SD
.subckt RX_SD pad nc vdd gnd dout
X1 pad vdd gnd dout IOBUF_IN CDIE=7p LPKG=3n CPKG=1p RPKG=0.2 VIHK=0.625 VILK=0.25 ILK=10u
Rnc nc gnd 1G
.ends RX_SD
.subckt TL_S3 a ra b rb
X1 a ra b rb TRACE_RLC LEN={LEN3} RL={ZR} LL={ZL} CL={ZC}
.ends TL_S3
.backanno
.end